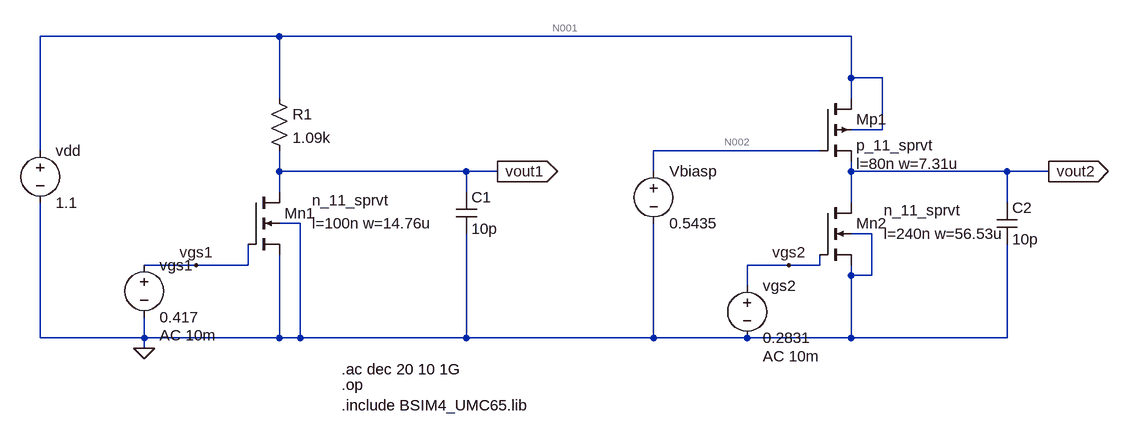
[diagram p0: schematic part3.asc]
part3.asc, the LTspice schematic file:
Version 4
SHEET 1 1756 756
WIRE 448 -80 80 -80
WIRE 1328 -80 448 -80
WIRE 1328 -16 1328 -80
WIRE 1376 -16 1328 -16
WIRE 448 16 448 -80
WIRE 1328 16 1328 -16
WIRE 1376 64 1376 -16
WIRE 1376 64 1328 64
WIRE 80 96 80 -80
WIRE 1280 96 1024 96
WIRE 448 128 448 96
WIRE 736 128 448 128
WIRE 784 128 736 128
WIRE 1024 128 1024 96
WIRE 1328 128 1328 112
WIRE 1568 128 1328 128
WIRE 1632 128 1568 128
WIRE 448 160 448 128
WIRE 736 160 736 128
WIRE 1328 176 1328 128
WIRE 1568 176 1568 128
WIRE 480 208 448 208
WIRE 1360 224 1328 224
WIRE 320 272 240 272
WIRE 400 272 400 240
WIRE 400 272 320 272
WIRE 1232 272 1168 272
WIRE 1280 272 1280 256
WIRE 1280 272 1232 272
WIRE 1328 288 1328 272
WIRE 1360 288 1360 224
WIRE 1360 288 1328 288
WIRE 1168 304 1168 272
WIRE 80 384 80 176
WIRE 240 384 240 352
WIRE 240 384 80 384
WIRE 448 384 448 256
WIRE 448 384 240 384
WIRE 480 384 480 208
WIRE 480 384 448 384
WIRE 736 384 736 224
WIRE 736 384 480 384
WIRE 1024 384 1024 208
WIRE 1024 384 736 384
WIRE 1168 384 1024 384
WIRE 1328 384 1328 288
WIRE 1328 384 1168 384
WIRE 1568 384 1568 240
WIRE 1568 384 1328 384
WIRE 240 400 240 384
FLAG 240 400 0
FLAG 320 272 vgs1
FLAG 784 128 vout1
IOPIN 784 128 Out
FLAG 1632 128 vout2
IOPIN 1632 128 Out
FLAG 1232 272 vgs2
SYMBOL voltage 240 256 R0
WINDOW 123 24 124 Left 2
WINDOW 39 0 0 Left 0
SYMATTR Value2 AC 10m
SYMATTR InstName vgs1
SYMATTR Value 0.417
SYMBOL voltage 80 80 R0
WINDOW 123 0 0 Left 0
WINDOW 39 0 0 Left 0
SYMATTR InstName vdd
SYMATTR Value 1.1
SYMBOL nmos4 400 160 R0
WINDOW 123 98 48 Left 2
WINDOW 3 98 12 Left 2
SYMATTR Value2 l=100n w=14.76u
SYMATTR Value n_11_sprvt
SYMATTR InstName Mn1
SYMBOL res 432 0 R0
SYMATTR InstName R1
SYMATTR Value 1.09k
SYMBOL nmos4 1280 176 R0
WINDOW 123 98 48 Left 2
WINDOW 3 98 12 Left 2
SYMATTR Value2 l=240n w=56.53u
SYMATTR Value n_11_sprvt
SYMATTR InstName Mn2
SYMBOL pmos4 1280 16 R0
WINDOW 123 56 100 Left 2
SYMATTR Value2 l=80n w=7.31u
SYMATTR InstName Mp1
SYMATTR Value p_11_sprvt
SYMBOL cap 720 160 R0
SYMATTR InstName C1
SYMATTR Value 10p
SYMBOL cap 1552 176 R0
SYMATTR InstName C2
SYMATTR Value 10p
SYMBOL voltage 1168 288 R0
WINDOW 123 24 124 Left 2
WINDOW 39 0 0 Left 0
SYMATTR Value2 AC 10m
SYMATTR InstName vgs2
SYMATTR Value 0.2831
SYMBOL voltage 1024 112 R0
WINDOW 123 24 124 Left 2
WINDOW 39 0 0 Left 0
SYMATTR InstName Vbiasp
SYMATTR Value 0.5435
TEXT 544 488 Left 2 !.include BSIM4_UMC65.lib
TEXT 544 456 Left 2 !.op
TEXT 544 432 Left 2 !.ac dec 20 10 1G

The netlist it stands for:
* part3.asc
vgs1 vgs1 0 0.417 AC 10m
vdd N001 0 1.1
Mn1 vout1 vgs1 0 0 n_11_sprvt l=100n w=14.76u
R1 N001 vout1 1.09k
Mn2 vout2 vgs2 0 0 n_11_sprvt l=240n w=56.53u
Mp1 N001 N002 vout2 N001 p_11_sprvt l=80n w=7.31u
C1 vout1 0 10p
C2 vout2 0 10p
vgs2 vgs2 0 0.2831 AC 10m
Vbiasp N002 0 0.5435
.model NMOS NMOS
.model PMOS PMOS
.lib standard.mos
.include BSIM4_UMC65.lib
.op
.ac dec 20 10 1G
.backanno
.end

* Results of the author's LTspice run, read from the files saved beside the schematic
* Operating Point, zero values left out:
*   V(vgs1) = 417 mV
*   V(n001) = 1.1 V
*   V(vout1) = 400.9 mV
*   V(vout2) = 365.9 mV
*   V(vgs2) = 283.1 mV
*   V(n002) = 543.5 mV
*   Id(Mp1) = 419.6 µA
*   Ig(Mp1) = -1.871 nA
*   Ib(Mp1) = 1.15 pA
*   Is(Mp1) = -419.6 µA
*   Id(Mn2) = 419.6 µA
*   Ig(Mn2) = 11.23 nA
*   Is(Mn2) = -419.6 µA
*   Id(Mn1) = 641.3 µA
*   Ig(Mn1) = 2.805 nA
*   Is(Mn1) = -641.3 µA
*   I(R1) = 641.3 µA
*   I(Vbiasp) = 1.871 nA
*   I(Vgs2) = -11.23 nA
*   I(Vdd) = -1.061 mA
*   I(Vgs1) = -2.805 nA
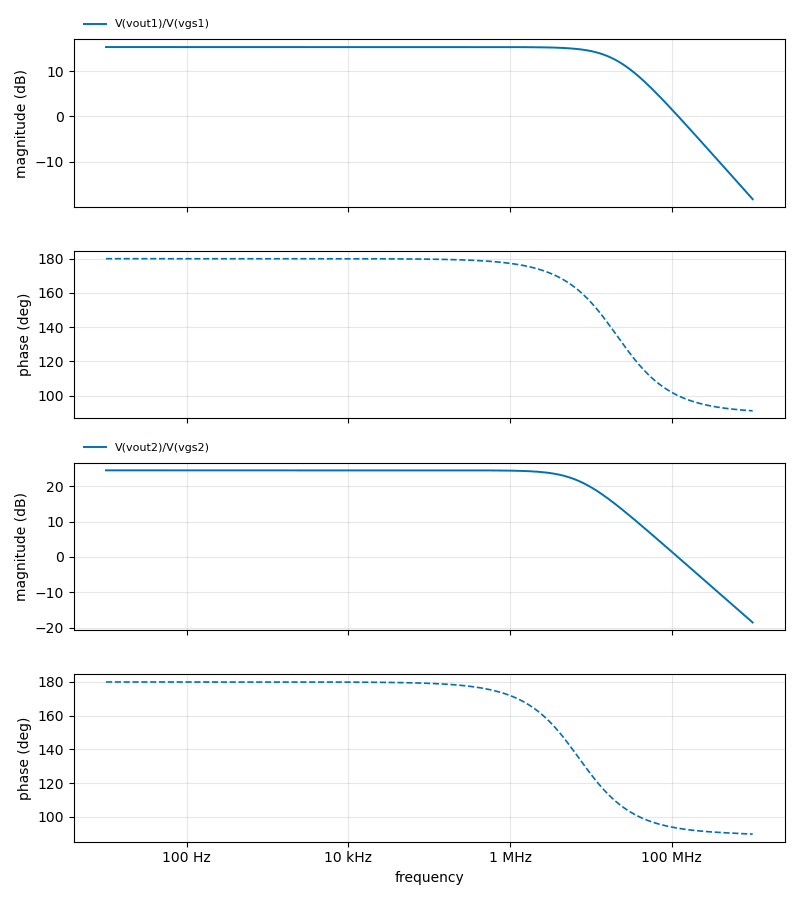
[diagram p1: AC Analysis of part3.asc, plotted from the saved traces]
* AC Analysis, 1 run:
*   V(vout1)/V(vgs1): 15.31 dB at 10 Hz, -18.27 dB at 1 GHz, peak 15.31 dB at 10 Hz, 3 dB below the peak at 20.92 MHz
*   V(vout2)/V(vgs2): 24.48 dB at 10 Hz, -18.53 dB at 1 GHz, peak 24.48 dB at 10 Hz, 3 dB below the peak at 7.072 MHz
* From the log:
*   Semiconductor Device Operating Points:
*                           --- BSIM4 MOSFETS ---
*   Name:      mp1         mn2         mn1
*   Model: p_11_sprvt  n_11_sprvt  n_11_sprvt
*   Id:      4.20e-04    4.20e-04    6.41e-04
*   Vgs:     1.78e-01    2.83e-01    4.17e-01
*   Vds:     7.34e-01    3.66e-01    4.01e-01
*   Vbs:     7.34e-01    0.00e+00    0.00e+00
*   Vth:    -3.47e-01    1.62e-01    2.92e-01
*   Vdsat:  -1.97e-01    8.10e-02    1.13e-01
*   Gm:      2.78e-03    7.47e-03    7.68e-03
*   Gds:     2.16e-04    2.31e-04    4.00e-04
*   Gmb      2.06e-04    5.66e-04    6.20e-04
*   Cbd:     3.73e-15    2.23e-14    5.77e-15
*   Cbs:     2.26e-15    2.61e-14    6.83e-15